# Altium schematic sheet Display.SchDoc
size A4; SheetNumber: 6; SheetTotal: 6
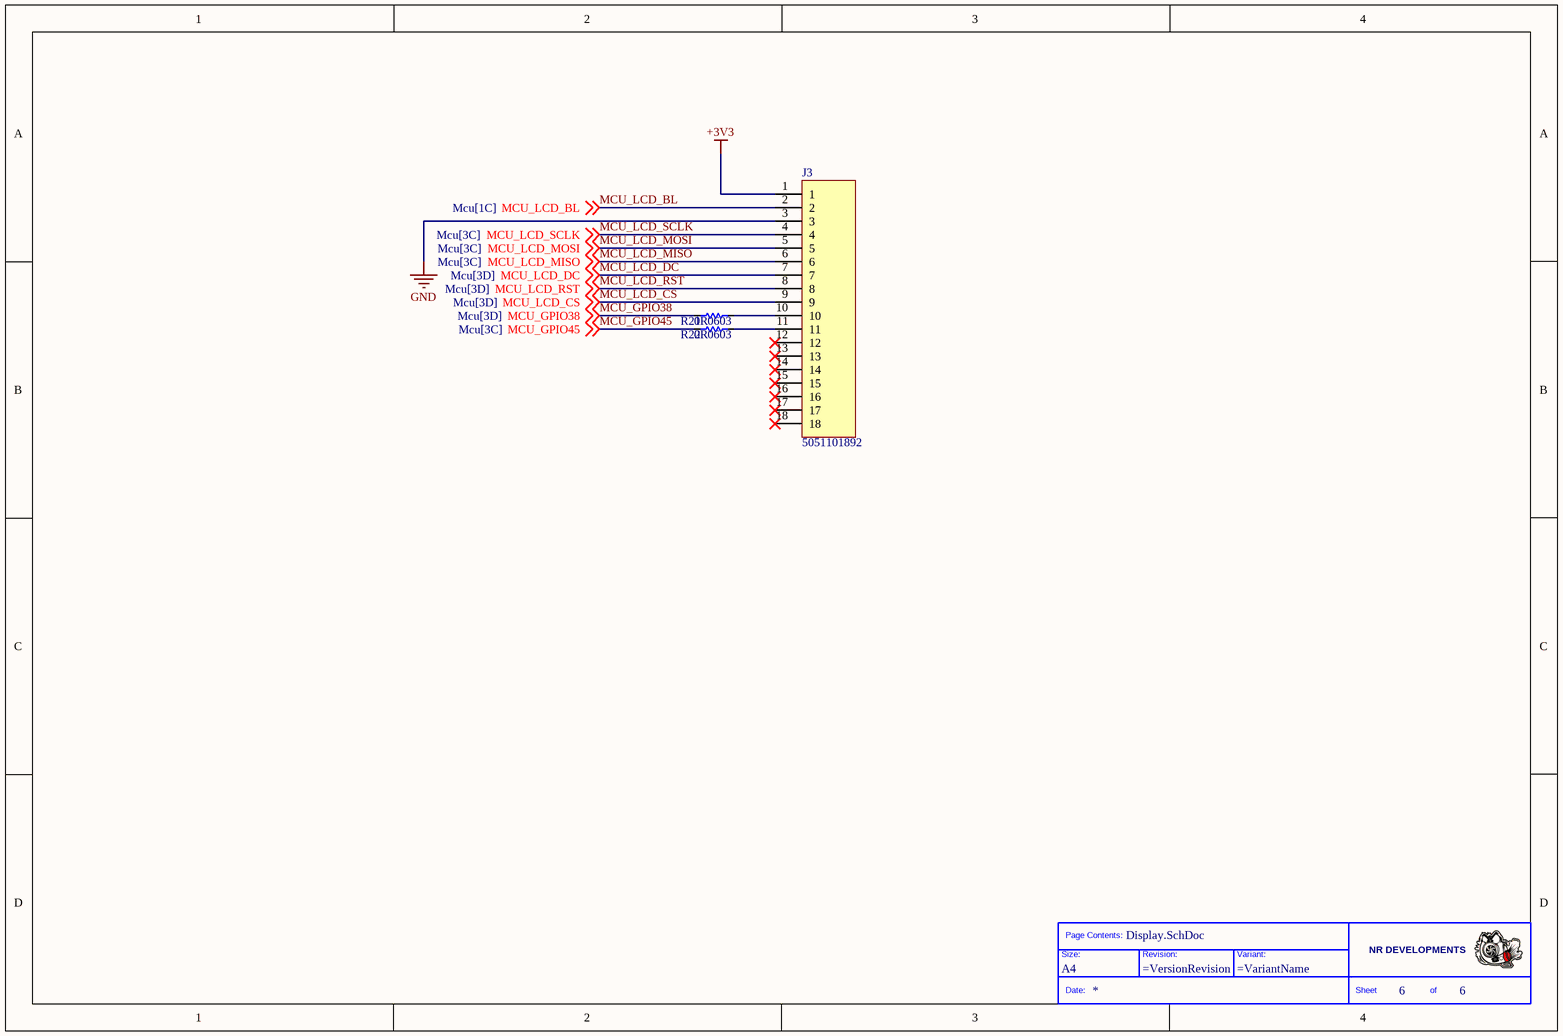
[diagram p0: Display.SchDoc]

## Parts
*  Size: A4  (hidden comment: Title_Block)  (graphical)
J3  value 5051101892  [MOLEX_5051101892]  (hidden comment: MOLEX_5051101892)
R21  value 0R  Case: 0603  [RESC1608X06M]  (hidden comment: CRCW06030000Z0EAC)
R22  value 0R  Case: 0603  [RESC1608X06M]  (hidden comment: CRCW06030000Z0EAC)

## Nets
+3V3: J3.1
GND: J3.3
MCU_GPIO38: R21.1 ; off-sheet MCU_GPIO38
MCU_GPIO45: R22.1 ; off-sheet MCU_GPIO45
MCU_LCD_BL: J3.2 ; off-sheet MCU_LCD_BL
MCU_LCD_CS: J3.9 ; off-sheet MCU_LCD_CS
MCU_LCD_DC: J3.7 ; off-sheet MCU_LCD_DC
MCU_LCD_MISO: J3.6 ; off-sheet MCU_LCD_MISO
MCU_LCD_MOSI: J3.5 ; off-sheet MCU_LCD_MOSI
MCU_LCD_RST: J3.8 ; off-sheet MCU_LCD_RST
MCU_LCD_SCLK: J3.4 ; off-sheet MCU_LCD_SCLK
NetJ3_10: J3.10 R21.2
NetJ3_11: J3.11 R22.2

Not connected (* = marked no-connect by the designer): J3 12* 13* 14* 15* 16* 17* 18*

## Notes on the sheet
- (in symbol Title_Block) Page Contents:; NR DEVELOPMENTS; Size:; Revision:; Variant:; Date:; Sheet; of

## Library data of the parts
J3 = MOLEX_5051101892: 18 Position FFC, FPC Connector Contacts, Bottom 0.020" (0.50mm) Surface Mount, Right Angle; Manufacturer: Molex; PartNumber: 5051101892
R21 R22 = Resistor: Manufacturer: Vishay; PartNumber: CRCW06030000Z0EE